# Altium schematic sheet HX PJ-320A-3P DIP.schdoc
size 127 x 101 mm
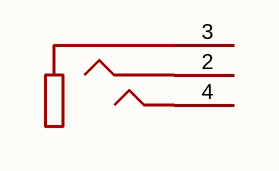
[diagram p0: HX PJ-320A-3P DIP.schdoc]

## Parts
U?  hx pj-320a-3p dip  [AUDIO-SMD_HX-PJ-320A-3P-DIP]  (value not drawn)

## Nets

Not connected (* = marked no-connect by the designer): U? 2 3 4

## Library data of the parts
U? = hx pj-320a-3p dip: Connector Type:3.5mm Headphone Jack Current Rating:500mA Voltage Rating (Max):30V Operating Temperature:-30℃~+70℃ Operating Temperature:-30℃~+70℃ Rank Number:TRS Mounting Style:Right-Angle Body Height:5mm Length:14.1mm Width:6mm; Manufacturer: hanxia(韩下); AddInBom: yes; ModelId: 923d6e27d97c4f22aad2a54d7c3d08e9; ModelTransform: 555.117,236.614,0,0,0,0,-49.212,-0.002,-106.299; Current Rating: 500mA; Voltage Rating (Max): 30V; Rank Number: TRS; Body Height: 5mm; Symbol: HX PJ-320A-3P DIP; LCSC Part Name: 3.5mm耳机座; SupplierPart: C19189087; ManufacturerPart: HX PJ-320A-3P DIP; Supplier Footprint: 插件; JLCPCB Part Class: Extended Part; Datasheet: https://item.szlcsc.com/datasheet/HX%2520PJ-320A-3P%2520DIP/20414042.html; Supplier: LCSC; ConvertToPcb: yes; FootprintName: AUDIO-SMD_HX-PJ-320A-3P-DIP; ModelName: AUDIO-SMD_HX-PJ-320A-3P-DIP; Connector Type: 3.5mm Headphone Jack; Operating Temperature: -30℃~+70℃; Mounting Style: Right-Angle; Length: 14.1mm; Width: 6mm